# Altium schematic sheet Compute.SchDoc
size A; SheetNumber: 2; SheetTotal: 7
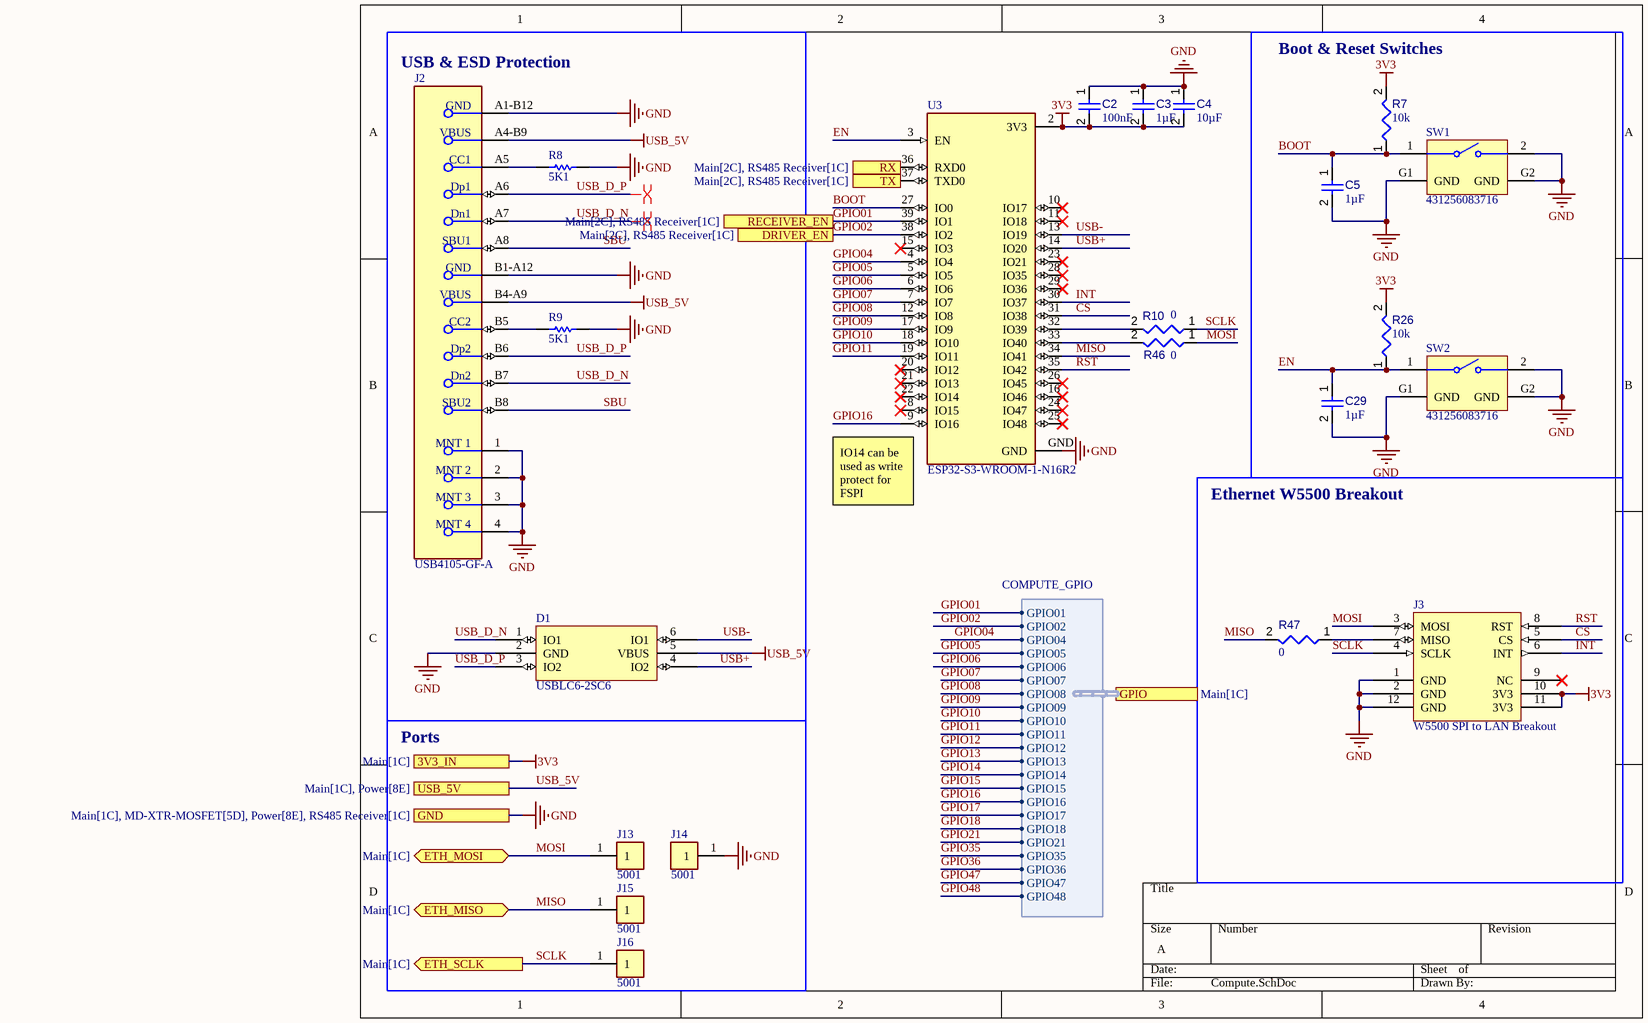
[diagram p0: Compute.SchDoc]

## Parts
C2  value 100nF  [CAPC1608X90X40NL10T20]  (hidden comment: Capacitor 100 nF +/-10% 50 V 0603)
C3  value 1µF  [CAPC1608X90X40LL10T20]  (hidden comment: Capacitor 1 uF +/- 10% 25 V 0603)
C4  value 10µF  [CAPC0603(1608)100_L]  (hidden comment: Capacitor 10µF +/-20% 10V 0603)
C5  value 1µF  [CAPC1608X90X40LL10T20]  (hidden comment: Capacitor 1 uF +/- 10% 25 V 0603)
C29  value 1µF  [CAPC1608X90X40LL10T20]  (hidden comment: Capacitor 1 uF +/- 10% 25 V 0603)
D1  USBLC6-2SC6  [STM-SOT23-6L_V]
J2  USB4105-GF-A  [FP-USB4105-GF-A-MFG]
J3  W5500 SPI to LAN Breakout  [W5500 SPI to LAN Breakout-Footprint-1]
J13  5001  [FP-5001-MFG]
J14  5001  [FP-5001-MFG]
J15  5001  [FP-5001-MFG]
J16  5001  [FP-5001-MFG]
R7  value 10k  [RESC1608X55X25ML10T15]  (hidden comment: Resistor 10k +/-1% 0603 100 mW)
R8  value 5K1  [RESC0603(1608)_L]  (hidden comment: Resistor 5.1k +/-1% 0603 100 mW)
R9  value 5K1  [RESC0603(1608)_L]  (hidden comment: Resistor 5.1k +/-1% 0603 100 mW)
R10  value 0  [RESC0603(1608)_L]  (hidden comment: 0R3J)
R26  value 10k  [RESC1608X55X25ML10T15]  (hidden comment: Resistor 10k +/-1% 0603 100 mW)
R46  value 0  [RESC0603(1608)_L]  (hidden comment: 0R3J)
R47  value 0  [RESC0603(1608)_L]  (hidden comment: 0R3J)
SW1  431256083716  [4312560837x6]
SW2  431256083716  [4312560837x6]
U3  ESP32-S3-WROOM-1-N16R2  [XCVR_ESP32-S3-WROOM-1-N16R2]

## Blocks framed on the sheet
USB & ESD Protection: D1 J2 R8 R9
Boot & Reset Switches: C5 C29 R7 R26 SW1 SW2
Ethernet W5500 Breakout: J3 R47
Ports: J13-J16

## Ports
3V3_IN (see Main[1C]), DRIVER_EN (see Main[2C], RS485 Receiver[1C]), ETH_MISO (bidir, see Main[1C]), ETH_MOSI (bidir, see Main[1C]), ETH_SCLK (out, see Main[1C]), GND (see Main[1C], MD-XTR-MOSFET[5D], Power[8E], RS485 Receiver[1C]), GPIO (harness COMPUTE_GPIO, see Main[1C]), RECEIVER_EN (see Main[2C], RS485 Receiver[1C]), RX (see Main[2C], RS485 Receiver[1C]), TX (see Main[2C], RS485 Receiver[1C]), USB_5V (see Main[1C], Power[8E])

## Harnesses
COMPUTE_GPIO: GPIO01, GPIO02, GPIO04, GPIO05, GPIO07, GPIO08, GPIO14, GPIO17, GPIO18, GPIO21, GPIO35, GPIO36, GPIO47, GPIO48, GPIO16, GPIO13, GPIO12, GPIO09, GPIO11, GPIO10, GPIO15, GPIO06

## Nets
3V3: C2.2 C3.2 C4.2 J3.10(3V3) J3.11(3V3) R7.2 R26.2 U3.2(3V3) ; port 3V3_IN
GND: C2.1 C3.1 C4.1 C5.2 C29.2 D1.2(GND) J2.1(MNT_1) J2.2(MNT_2) J2.3(MNT_3) J2.4(MNT_4) J2.A1-B12(GND) J2.B1-A12(GND) J3.1(GND) J3.2(GND) J3.12(GND) J14.1 R8.2 R9.2 SW1.2 SW1.G1(GND) SW1.G2(GND) SW2.2 SW2.G1(GND) SW2.G2(GND) U3.GND ; port GND
USB_5V: D1.5(VBUS) J2.A4-B9(VBUS) J2.B4-A9(VBUS) ; port USB_5V
BOOT: C5.1 R7.1 SW1.1 U3.27(IO0)
CS: J3.5(CS) U3.31(IO38)
EN: C29.1 R26.1 SW2.1 U3.3(EN)
GPIO01: U3.39(IO1) ; port RECEIVER_EN, port GPIO.GPIO01
GPIO02: U3.38(IO2) ; port DRIVER_EN, port GPIO.GPIO02
GPIO04: U3.4(IO4) ; port GPIO.GPIO04
GPIO05: U3.5(IO5) ; port GPIO.GPIO05
GPIO06: U3.6(IO6) ; port GPIO.GPIO06
GPIO07: U3.7(IO7) ; port GPIO.GPIO07
GPIO08: U3.12(IO8) ; port GPIO.GPIO08
GPIO09: U3.17(IO9) ; port GPIO.GPIO09
GPIO10: U3.18(IO10) ; port GPIO.GPIO10
GPIO11: U3.19(IO11) ; port GPIO.GPIO11
GPIO12: port GPIO.GPIO12
GPIO13: port GPIO.GPIO13
GPIO14: port GPIO.GPIO14
GPIO15: port GPIO.GPIO15
GPIO16: U3.9(IO16) ; port GPIO.GPIO16
GPIO17: port GPIO.GPIO17
GPIO18: port GPIO.GPIO18
GPIO21: port GPIO.GPIO21
GPIO35: port GPIO.GPIO35
GPIO36: port GPIO.GPIO36
GPIO47: port GPIO.GPIO47
GPIO48: port GPIO.GPIO48
INT: J3.6(INT) U3.30(IO37)
MISO: J15.1 R47.2 U3.34(IO41) ; port ETH_MISO
MOSI: J3.3(MOSI) J13.1 R46.1 ; port ETH_MOSI
RST: J3.8(RST) U3.35(IO42)
RX: U3.36(RXD0) ; port RX
SBU: J2.A8(SBU1) J2.B8(SBU2)
SCLK: J3.4(SCLK) J16.1 R10.1 ; port ETH_SCLK
TX: U3.37(TXD0) ; port TX
USB+: D1.4(IO2) U3.14(IO20)
USB-: D1.6(IO1) U3.13(IO19)
USB_D_N: D1.1(IO1) J2.A7(Dn1) J2.B7(Dn2)
USB_D_P: D1.3(IO2) J2.A6(Dp1) J2.B6(Dp2)
NetJ2_A5: J2.A5(CC1) R8.1
NetJ2_B5: J2.B5(CC2) R9.1
NetJ3_7: J3.7(MISO) R47.1
NetR10_2: R10.2 U3.32(IO39)
NetR46_2: R46.2 U3.33(IO40)

Not connected (* = marked no-connect by the designer): J3 9(NC)*; U3 8(IO15)* 10(IO17)* 11(IO18)* 15(IO3)* 16(IO46)* 20(IO12)* 21(IO13)* 22(IO14)* 23(IO21)* 24(IO47)* 25(IO48)* 26(IO45)* 28(IO35)* 29(IO36)*

## Layout directives
differential pair: USB_D_N, USB_D_P

## Notes on the sheet
- (near U3) IO14 can be used as write protect for FSPI

## Library data of the parts
C2 = CMP-001-00017-6: Chip Capacitor, 100 nF, +/- 10%, 50 V, 0603 (1608 Metric); Voltage Rating: 50V; Capacitor Type: Ceramic; Tolerance: 10%; Mounting Technology: SM; Max Operating Temperature: 125°C; RoHS Compliant: True; Pins: 2; Case/Package: 0603; Min Operating Temperature: -55°C
C3 C5 C29 = CMP-001-00005-6: Chip Capacitor, 1 uF, +/- 10%, 25 V, 0603 (1608 Metric); Capacitor Type: Ceramic; Voltage Rating: 25V; Pins: 2; Mounting Technology: SM; RoHS Compliant: True; Max Operating Temperature: 125°C; Case/Package: 0603; Min Operating Temperature: -55°C; Tolerance: 10%
C4 = CMP-001-00075-4: Chip Capacitor, 10µF +/-20%, 10V, 0603, Thickness 1 mm; Tolerance: 10%; Voltage Rating: 10V; Max Operating Temperature: 85°C; Pins: 2; Case/Package: 0603; Mounting Technology: SMT; Min Operating Temperature: -55°C
D1 = CMP-019-00050-4: Trans Voltage Suppressor Diode, 5V V(RWM), Unidirectional, 1 Element, Silicon; Max Operating Temperature: 125°C; RoHS Compliant: Yes; Min Operating Temperature: -40°C; Pins: 6
J2 = CMP-002-00075-1: Conn USB 2.0 Type C RCP 24 POS 0.3mm/0.5mm Solder RA SMD 24 Terminal 1 Port T/R
J3 = CMP-00030-00004-2: 2.54mm pitch pins footprint for HiLetgo W5500 breakout board (linked).; ComponentLink1Description: https://www.amazon.com/HiLetgo-Ethernet-Network-Interface-WIZ820io/dp/B08KXM8TKJ
J13-J16 = CMP-00011-2: THT TEST POINT, HOOK
R7 R26 = CMP-009-00017-5: Chip Resistor, 10 KOhm, +/- 1%, 01 W, -55 to 155 degC, 0603 (1608 Metric); Voltage Rating: 50V; Power: 100mW; RoHS Compliant: True; Min Operating Temperature: -55°C; Pins: 2; Case/Package: 0603; Mounting Technology: SM; Max Operating Temperature: 155°C; Tolerance: 1%
R8 R9 = CMP-009-00196-2: 5.1 kOhms ±1% 0.1W, 1/10W Chip Resistor 0603 (1608 Metric) Thick Film; Tolerance: 1%; Case/Package: 0603
R10 R46 R47 = CMP-009-00063-2: Jumper 0603 (1608 Metric); Case/Package: 0603; Mounting Technology: SMT; Pins: 2
SW1 SW2 = CMP-00014-1: Button, through-hole, right-angle, long; Manufacturer Series: 431256; Switch Function: SPST; End Contact Material: Stainless Steel; PCB Hole Count: 4; Switch Type: Keypad; Solderability: WAVE; Contact Resistance: 0.1mR; Center Contact Plating: Silver; Insulation Resistance: 100MR; Contact DC Max Rating R Load: 0.05A@12VDC; Body Length or Diameter: 7.3914mm; Actuator Type: Pushbutton; Actuator Length: 0.229inch; Body Height: 6.5532mm; Contact Current(DC)-Max: 50mA; Actuator Material: Polymer; Contact Voltage(DC)-Max: 12V; Actuator Color: Black; Body Breadth: 7.1882mm; Dielectric Withstand Volts: 250VACV; Mounting Technology: Through Hole; Reach SVHC Compliant: Yes; Max Operating Temperature: 85°C; Housing Material: Polymer; Min Operating Temperature: -40°C; Contact Material: Stainless Steel; End Contact Plating: Silver; RoHS Compliant: Yes; Termination: Solder; Terminal Material: Copper Alloy; Terminal Length: 0.138inch
U3 = CMP-118-000000-2: Bluetooth, WiFi 802.11b/g/n, Bluetooth v5.0 Transceiver Module 2.4GHz PCB Trace Surface Mount; MP: ESP32S3WROOM1N16R2; MF: Espressif Systems; SnapEDA_Link: https://www.snapeda.com/parts/ESP32S3WROOM1N16R2/Espressif+Systems/view-part/?ref=snap; Component Type: Standard; Package: NON STANDARD Espressif Systems; Source: ESP32-S3-WROOM-1-N16R2.SchLib; Design Item ID: ESP32-S3-WROOM-1-N16R2; Pin Count: 39; Value: *; Check_prices: https://www.snapeda.com/parts/ESP32S3WROOM1N16R2/Espressif+Systems/view-part/?ref=eda